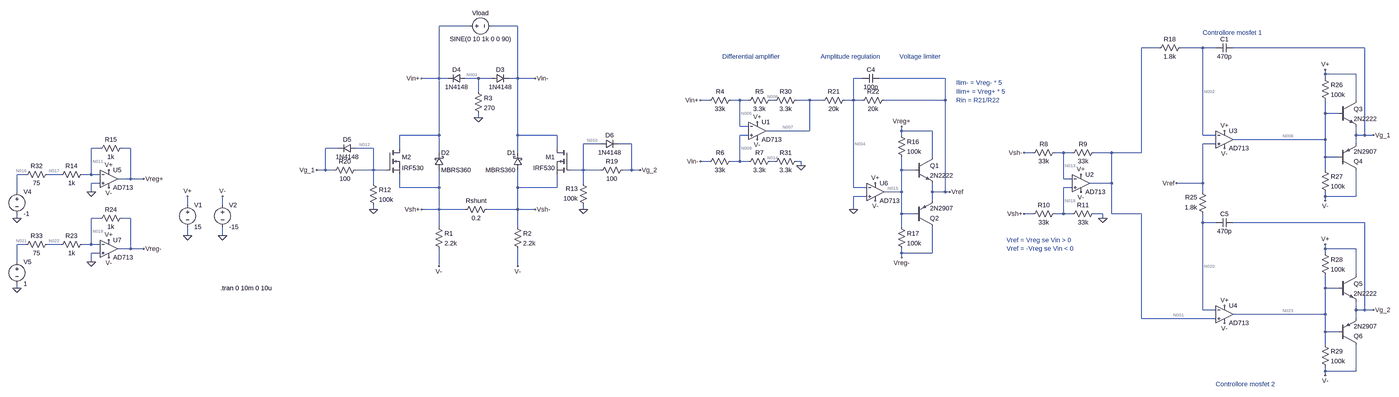
[diagram p0: schematic Electronic load.asc, whole sheet]
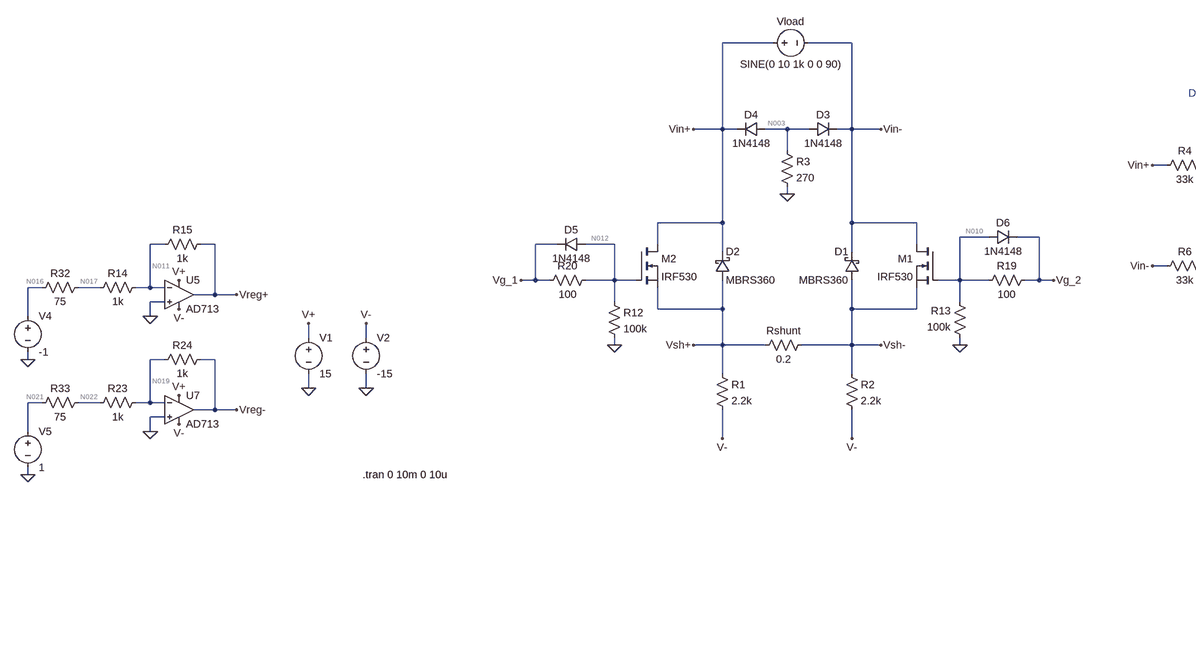
[diagram p1: schematic Electronic load.asc, part, row 1 of 1, column 1 of 2]
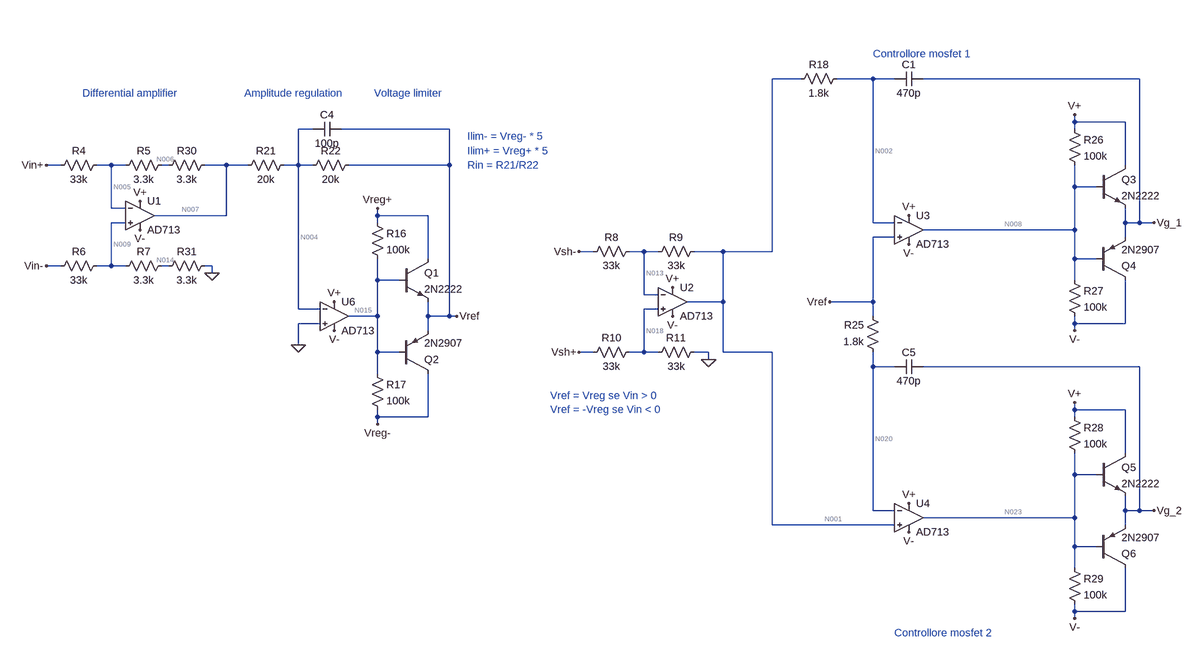
[diagram p2: schematic Electronic load.asc, part, row 1 of 1, column 2 of 2]
Electronic load.asc, the LTspice schematic file:
Version 4
SHEET 1 4616 896
WIRE -144 -496 -256 -496
WIRE 32 -496 -64 -496
WIRE 2464 -416 2400 -416
WIRE 2624 -416 2544 -416
WIRE 2672 -416 2624 -416
WIRE 3280 -416 2736 -416
WIRE 3136 -320 3136 -336
WIRE 3248 -320 3136 -320
WIRE -256 -304 -256 -496
WIRE -256 -304 -320 -304
WIRE -224 -304 -256 -304
WIRE -112 -304 -160 -304
WIRE -64 -304 -112 -304
WIRE 32 -304 32 -496
WIRE 32 -304 0 -304
WIRE 96 -304 32 -304
WIRE 1312 -304 1280 -304
WIRE 1616 -304 1376 -304
WIRE 3136 -304 3136 -320
WIRE -112 -256 -112 -304
WIRE 752 -224 720 -224
WIRE 864 -224 832 -224
WIRE 896 -224 864 -224
WIRE 992 -224 976 -224
WIRE 1120 -224 1072 -224
WIRE 1168 -224 1120 -224
WIRE 1280 -224 1280 -304
WIRE 1280 -224 1248 -224
WIRE 1312 -224 1280 -224
WIRE 1616 -224 1616 -304
WIRE 1616 -224 1392 -224
WIRE 3248 -224 3248 -320
WIRE 3136 -176 3136 -224
WIRE 3184 -176 3136 -176
WIRE -112 -160 -112 -176
WIRE 864 -128 864 -224
WIRE 896 -128 864 -128
WIRE 1120 -112 1120 -224
WIRE 1120 -112 960 -112
WIRE 1456 -112 1456 -128
WIRE 1568 -112 1456 -112
WIRE -256 -96 -256 -304
WIRE -256 -96 -400 -96
WIRE 32 -96 32 -304
WIRE 176 -96 32 -96
WIRE 896 -96 864 -96
WIRE 1456 -96 1456 -112
WIRE 2624 -96 2624 -416
WIRE 2672 -96 2624 -96
WIRE 3248 -96 3248 -128
WIRE 3280 -96 3280 -416
WIRE 3280 -96 3248 -96
WIRE 3312 -96 3280 -96
WIRE 3136 -80 3136 -176
WIRE 3136 -80 2736 -80
WIRE 336 -64 272 -64
WIRE 448 -64 400 -64
WIRE 2672 -64 2624 -64
WIRE 3248 -64 3248 -96
WIRE -1536 -48 -1568 -48
WIRE -1424 -48 -1456 -48
WIRE -624 -48 -672 -48
WIRE -496 -48 -560 -48
WIRE -400 -48 -400 -96
WIRE 176 -48 176 -96
WIRE -256 -32 -256 -96
WIRE 32 -32 32 -96
WIRE 1936 -32 1904 -32
WIRE 2048 -32 2016 -32
WIRE 2080 -32 2048 -32
WIRE 2224 -32 2160 -32
WIRE 2400 -32 2400 -416
WIRE 2400 -32 2224 -32
WIRE 1568 -16 1568 -112
WIRE 3136 -16 3136 -80
WIRE 3184 -16 3136 -16
WIRE 752 0 720 0
WIRE 864 0 864 -96
WIRE 864 0 832 0
WIRE 896 0 864 0
WIRE 992 0 976 0
WIRE 1088 0 1072 0
WIRE 1088 16 1088 0
WIRE -672 32 -672 -48
WIRE -672 32 -704 32
WIRE -640 32 -672 32
WIRE -496 32 -496 -48
WIRE -496 32 -560 32
WIRE -448 32 -496 32
WIRE 272 32 272 -64
WIRE 272 32 224 32
WIRE 336 32 272 32
WIRE 448 32 448 -64
WIRE 448 32 416 32
WIRE 480 32 448 32
WIRE 1456 32 1456 -16
WIRE 1504 32 1456 32
WIRE 3136 32 3136 -16
WIRE -1808 48 -1840 48
WIRE -1680 48 -1728 48
WIRE -1568 48 -1568 -48
WIRE -1568 48 -1600 48
WIRE -1536 48 -1568 48
WIRE -1424 64 -1424 -48
WIRE -1424 64 -1472 64
WIRE -1376 64 -1424 64
WIRE 2048 64 2048 -32
WIRE 2080 64 2048 64
WIRE -1536 80 -1568 80
WIRE -496 80 -496 32
WIRE 272 80 272 32
WIRE 2224 80 2224 -32
WIRE 2224 80 2144 80
WIRE 2624 80 2624 -64
WIRE 2624 80 2528 80
WIRE -400 96 -400 48
WIRE -256 96 -256 32
WIRE -256 96 -400 96
WIRE 32 96 32 32
WIRE 176 96 176 48
WIRE 176 96 32 96
WIRE 1280 96 1280 -224
WIRE 1328 96 1280 96
WIRE 2080 96 2048 96
WIRE -1840 112 -1840 48
WIRE -1568 112 -1568 80
WIRE 1456 112 1456 32
WIRE 1456 112 1392 112
WIRE 1568 112 1568 80
WIRE 1616 112 1616 -224
WIRE 1616 112 1568 112
WIRE 1632 112 1616 112
WIRE 2624 112 2624 80
WIRE 1328 128 1280 128
WIRE 3136 128 3136 112
WIRE 3248 128 3248 32
WIRE 3248 128 3136 128
WIRE 1568 144 1568 112
WIRE 3136 144 3136 128
WIRE -1216 160 -1216 128
WIRE -1088 160 -1088 128
WIRE -496 176 -496 160
WIRE -256 176 -256 96
WIRE -256 176 -320 176
WIRE -160 176 -256 176
WIRE 32 176 32 96
WIRE 32 176 -80 176
WIRE 96 176 32 176
WIRE 272 176 272 160
WIRE 1280 176 1280 128
WIRE 1456 192 1456 112
WIRE 1504 192 1456 192
WIRE 1936 192 1904 192
WIRE 2048 192 2048 96
WIRE 2048 192 2016 192
WIRE 2080 192 2048 192
WIRE 2192 192 2160 192
WIRE 2224 192 2224 80
WIRE 2400 192 2224 192
WIRE -1840 208 -1840 192
WIRE -1536 208 -1568 208
WIRE -1424 208 -1456 208
WIRE 2192 208 2192 192
WIRE 2624 224 2624 192
WIRE 2672 224 2624 224
WIRE 3280 224 2736 224
WIRE -256 240 -256 176
WIRE 32 240 32 176
WIRE 1456 240 1456 192
WIRE -1216 272 -1216 240
WIRE -1088 272 -1088 240
WIRE -1808 304 -1840 304
WIRE -1680 304 -1728 304
WIRE -1568 304 -1568 208
WIRE -1568 304 -1600 304
WIRE -1536 304 -1568 304
WIRE -1424 320 -1424 208
WIRE -1424 320 -1472 320
WIRE -1376 320 -1424 320
WIRE 3136 320 3136 304
WIRE 3248 320 3136 320
WIRE -1536 336 -1568 336
WIRE 1456 336 1456 320
WIRE 1568 336 1568 240
WIRE 1568 336 1456 336
WIRE 3136 336 3136 320
WIRE 1456 352 1456 336
WIRE -1840 368 -1840 304
WIRE -1568 368 -1568 336
WIRE -256 384 -256 320
WIRE 32 384 32 320
WIRE 3248 416 3248 320
WIRE -1840 464 -1840 448
WIRE 3136 464 3136 416
WIRE 3184 464 3136 464
WIRE 2624 544 2624 224
WIRE 2672 544 2624 544
WIRE 3248 544 3248 512
WIRE 3280 544 3280 224
WIRE 3280 544 3248 544
WIRE 3312 544 3280 544
WIRE 3136 560 3136 464
WIRE 3136 560 2736 560
WIRE 2400 576 2400 192
WIRE 2672 576 2400 576
WIRE 3248 576 3248 544
WIRE 3136 624 3136 560
WIRE 3184 624 3136 624
WIRE 3136 672 3136 624
WIRE 3136 768 3136 752
WIRE 3248 768 3248 672
WIRE 3248 768 3136 768
WIRE 3136 784 3136 768
FLAG -1088 272 0
FLAG -1216 272 0
FLAG -1216 128 V+
FLAG -1088 128 V-
FLAG -256 384 V-
FLAG 32 384 V-
FLAG -112 -160 0
FLAG 928 -80 V-
FLAG 928 -144 V+
FLAG 1088 16 0
FLAG 2112 112 V-
FLAG 2112 48 V+
FLAG 2192 208 0
FLAG -320 -304 Vin+
FLAG 96 -304 Vin-
FLAG -320 176 Vsh+
FLAG 96 176 Vsh-
FLAG 720 -224 Vin+
FLAG 720 0 Vin-
FLAG 1904 192 Vsh+
FLAG 1904 -32 Vsh-
FLAG 480 32 Vg_2
FLAG 2704 -48 V-
FLAG 2704 -112 V+
FLAG 3312 -96 Vg_1
FLAG -704 32 Vg_1
FLAG 1456 -128 Vreg+
FLAG 1456 352 Vreg-
FLAG 1360 144 V-
FLAG 1360 80 V+
FLAG 1632 112 Vref
FLAG 2528 80 Vref
FLAG 1280 176 0
FLAG -496 176 0
FLAG 272 176 0
FLAG 3136 -336 V+
FLAG 3136 144 V-
FLAG 2704 592 V-
FLAG 2704 528 V+
FLAG 3136 304 V+
FLAG 3136 784 V-
FLAG 3312 544 Vg_2
FLAG -1504 96 V-
FLAG -1504 32 V+
FLAG -1376 64 Vreg+
FLAG -1840 208 0
FLAG -1568 112 0
FLAG -1504 352 V-
FLAG -1504 288 V+
FLAG -1376 320 Vreg-
FLAG -1568 368 0
FLAG -1840 464 0
SYMBOL voltage -1216 144 R0
SYMATTR InstName V1
SYMATTR Value 15
SYMBOL voltage -1088 144 R0
SYMATTR InstName V2
SYMATTR Value -15
SYMBOL nmos 224 -48 M0
SYMATTR InstName M1
SYMATTR Value IRF530
SYMBOL nmos -448 -48 R0
SYMATTR InstName M2
SYMATTR Value IRF530
SYMBOL schottky -272 32 M180
WINDOW 0 24 64 Left 2
WINDOW 3 24 0 Left 2
SYMATTR InstName D2
SYMATTR Value MBRS360
SYMATTR Description Diode
SYMATTR Type diode
SYMBOL res -176 192 R270
WINDOW 0 32 56 VTop 2
WINDOW 3 0 56 VBottom 2
SYMATTR InstName Rshunt
SYMATTR Value 0.2
SYMBOL res -272 224 R0
SYMATTR InstName R1
SYMATTR Value 2.2k
SYMBOL res 16 224 R0
SYMATTR InstName R2
SYMATTR Value 2.2k
SYMBOL diode -64 -320 M90
WINDOW 0 0 32 VBottom 2
WINDOW 3 32 32 VTop 2
SYMATTR InstName D3
SYMATTR Value 1N4148
SYMBOL diode -160 -288 M270
WINDOW 0 32 32 VTop 2
WINDOW 3 0 32 VBottom 2
SYMATTR InstName D4
SYMATTR Value 1N4148
SYMBOL res -128 -272 R0
SYMATTR InstName R3
SYMATTR Value 270
SYMBOL schottky 48 32 R180
WINDOW 0 24 64 Left 2
WINDOW 3 24 0 Left 2
SYMATTR InstName D1
SYMATTR Value MBRS360
SYMATTR Description Diode
SYMATTR Type diode
SYMBOL OpAmps\\AD713 928 -176 R0
SYMATTR InstName U1
SYMBOL res 848 -240 R90
WINDOW 0 0 56 VBottom 2
WINDOW 3 32 56 VTop 2
SYMATTR InstName R4
SYMATTR Value 33k
SYMBOL res 992 -240 R90
WINDOW 0 0 56 VBottom 2
WINDOW 3 32 56 VTop 2
SYMATTR InstName R5
SYMATTR Value 3.3k
SYMBOL res 848 -16 R90
WINDOW 0 0 56 VBottom 2
WINDOW 3 32 56 VTop 2
SYMATTR InstName R6
SYMATTR Value 33k
SYMBOL res 992 -16 R90
WINDOW 0 0 56 VBottom 2
WINDOW 3 32 56 VTop 2
SYMATTR InstName R7
SYMATTR Value 3.3k
SYMBOL OpAmps\\AD713 2112 16 R0
SYMATTR InstName U2
SYMBOL res 2032 -48 R90
WINDOW 0 0 56 VBottom 2
WINDOW 3 32 56 VTop 2
SYMATTR InstName R8
SYMATTR Value 33k
SYMBOL res 2176 -48 R90
WINDOW 0 0 56 VBottom 2
WINDOW 3 32 56 VTop 2
SYMATTR InstName R9
SYMATTR Value 33k
SYMBOL res 2032 176 R90
WINDOW 0 0 56 VBottom 2
WINDOW 3 32 56 VTop 2
SYMATTR InstName R10
SYMATTR Value 33k
SYMBOL res 2176 176 R90
WINDOW 0 0 56 VBottom 2
WINDOW 3 32 56 VTop 2
SYMATTR InstName R11
SYMATTR Value 33k
SYMBOL voltage -160 -496 M90
WINDOW 0 -32 56 VBottom 2
WINDOW 3 32 56 VTop 2
WINDOW 123 0 0 Left 0
WINDOW 39 0 0 Left 0
SYMATTR InstName Vload
SYMATTR Value SINE(0 10 1k 0 0 90)
SYMBOL OpAmps\\AD713 2704 -144 R0
SYMATTR InstName U3
SYMBOL res 432 16 R90
WINDOW 0 0 56 VBottom 2
WINDOW 3 32 56 VTop 2
SYMATTR InstName R19
SYMATTR Value 100
SYMBOL res -656 48 R270
WINDOW 0 32 56 VTop 2
WINDOW 3 0 56 VBottom 2
SYMATTR InstName R20
SYMATTR Value 100
SYMBOL cap 2736 -432 R90
WINDOW 0 0 32 VBottom 2
WINDOW 3 32 32 VTop 2
SYMATTR InstName C1
SYMATTR Value 470p
SYMBOL res 2560 -432 R90
WINDOW 0 0 56 VBottom 2
WINDOW 3 32 56 VTop 2
SYMATTR InstName R18
SYMATTR Value 1.8k
SYMBOL npn 1504 -16 R0
SYMATTR InstName Q1
SYMATTR Value 2N2222
SYMBOL pnp 1504 240 M180
SYMATTR InstName Q2
SYMATTR Value 2N2907
SYMBOL res 1440 -112 R0
SYMATTR InstName R16
SYMATTR Value 100k
SYMBOL res 1440 224 R0
SYMATTR InstName R17
SYMATTR Value 100k
SYMBOL OpAmps\\AD713 1360 48 R0
SYMATTR InstName U6
SYMBOL res 1264 -240 R90
WINDOW 0 0 56 VBottom 2
WINDOW 3 32 56 VTop 2
SYMATTR InstName R21
SYMATTR Value 20k
SYMBOL res 1408 -240 R90
WINDOW 0 0 56 VBottom 2
WINDOW 3 32 56 VTop 2
SYMATTR InstName R22
SYMATTR Value 20k
SYMBOL cap 1376 -320 R90
WINDOW 0 0 32 VBottom 2
WINDOW 3 32 32 VTop 2
SYMATTR InstName C4
SYMATTR Value 100p
SYMBOL res -512 64 R0
SYMATTR InstName R12
SYMATTR Value 100k
SYMBOL res 288 176 R180
WINDOW 0 36 76 Left 2
WINDOW 3 36 40 Left 2
SYMATTR InstName R13
SYMATTR Value 100k
SYMBOL diode -560 -32 M270
WINDOW 0 32 32 VTop 2
WINDOW 3 0 32 VBottom 2
SYMATTR InstName D5
SYMATTR Value 1N4148
SYMBOL diode 336 -80 M90
WINDOW 0 0 32 VBottom 2
WINDOW 3 32 32 VTop 2
SYMATTR InstName D6
SYMATTR Value 1N4148
SYMBOL npn 3184 -224 R0
SYMATTR InstName Q3
SYMATTR Value 2N2222
SYMBOL pnp 3184 32 M180
SYMATTR InstName Q4
SYMATTR Value 2N2907
SYMBOL res 3120 -320 R0
SYMATTR InstName R26
SYMATTR Value 100k
SYMBOL res 3120 16 R0
SYMATTR InstName R27
SYMATTR Value 100k
SYMBOL OpAmps\\AD713 2704 496 R0
SYMATTR InstName U4
SYMBOL cap 2736 208 R90
WINDOW 0 0 32 VBottom 2
WINDOW 3 32 32 VTop 2
SYMATTR InstName C5
SYMATTR Value 470p
SYMBOL res 2640 208 R180
WINDOW 0 36 76 Left 2
WINDOW 3 36 40 Left 2
SYMATTR InstName R25
SYMATTR Value 1.8k
SYMBOL npn 3184 416 R0
SYMATTR InstName Q5
SYMATTR Value 2N2222
SYMBOL pnp 3184 672 M180
SYMATTR InstName Q6
SYMATTR Value 2N2907
SYMBOL res 3120 320 R0
SYMATTR InstName R28
SYMATTR Value 100k
SYMBOL res 3120 656 R0
SYMATTR InstName R29
SYMATTR Value 100k
SYMBOL res 1088 -240 R90
WINDOW 0 0 56 VBottom 2
WINDOW 3 32 56 VTop 2
SYMATTR InstName R30
SYMATTR Value 3.3k
SYMBOL res 1088 -16 R90
WINDOW 0 0 56 VBottom 2
WINDOW 3 32 56 VTop 2
SYMATTR InstName R31
SYMATTR Value 3.3k
SYMBOL OpAmps\\AD713 -1504 0 R0
SYMATTR InstName U5
SYMBOL res -1584 32 R90
WINDOW 0 0 56 VBottom 2
WINDOW 3 32 56 VTop 2
SYMATTR InstName R14
SYMATTR Value 1k
SYMBOL res -1440 -64 R90
WINDOW 0 0 56 VBottom 2
WINDOW 3 32 56 VTop 2
SYMATTR InstName R15
SYMATTR Value 1k
SYMBOL voltage -1840 96 R0
WINDOW 123 0 0 Left 0
WINDOW 39 0 0 Left 0
SYMATTR InstName V4
SYMATTR Value -1
SYMBOL OpAmps\\AD713 -1504 256 R0
SYMATTR InstName U7
SYMBOL res -1584 288 R90
WINDOW 0 0 56 VBottom 2
WINDOW 3 32 56 VTop 2
SYMATTR InstName R23
SYMATTR Value 1k
SYMBOL res -1440 192 R90
WINDOW 0 0 56 VBottom 2
WINDOW 3 32 56 VTop 2
SYMATTR InstName R24
SYMATTR Value 1k
SYMBOL res -1712 32 R90
WINDOW 0 0 56 VBottom 2
WINDOW 3 32 56 VTop 2
SYMATTR InstName R32
SYMATTR Value 75
SYMBOL voltage -1840 352 R0
WINDOW 123 0 0 Left 0
WINDOW 39 0 0 Left 0
SYMATTR InstName V5
SYMATTR Value 1
SYMBOL res -1712 288 R90
WINDOW 0 0 56 VBottom 2
WINDOW 3 32 56 VTop 2
SYMATTR InstName R33
SYMATTR Value 75
TEXT -1096 464 Left 2 !.tran 0 10m 0 10u
TEXT 1840 288 Left 2 ;Vref = Vreg se Vin > 0\nVref = -Vreg se Vin < 0
TEXT 1448 -384 Left 2 ;Voltage limiter
TEXT 1160 -384 Left 2 ;Amplitude regulation
TEXT 800 -384 Left 2 ;Differential amplifier
TEXT 2624 -472 Left 2 ;Controllore mosfet 1
TEXT 2672 816 Left 2 ;Controllore mosfet 2
TEXT 1656 -224 Left 2 ;Rin = R21/R22
TEXT 1656 -256 Left 2 ;Ilim+ = Vreg+ * 5
TEXT 1656 -288 Left 2 ;Ilim- = Vreg- * 5

The netlist it stands for:
* Electronic load.asc
V1 V+ 0 15
V2 V- 0 -15
M1 Vin- N010 Vsh- Vsh- IRF530
M2 Vin+ N012 Vsh+ Vsh+ IRF530
D2 Vsh+ Vin+ MBRS360
Rshunt Vsh+ Vsh- 0.2
R1 Vsh+ V- 2.2k
R2 Vsh- V- 2.2k
D3 N003 Vin- 1N4148
D4 N003 Vin+ 1N4148
R3 N003 0 270
D1 Vsh- Vin- MBRS360
XU1 N009 N005 V+ V- N007 AD712  ; AD713, pins In+ In- V+ V- OUT
R4 N005 Vin+ 33k
R5 N006 N005 3.3k
R6 N009 Vin- 33k
R7 N014 N009 3.3k
XU2 N018 N013 V+ V- N001 AD712  ; AD713, pins In+ In- V+ V- OUT
R8 N013 Vsh- 33k
R9 N001 N013 33k
R10 N018 Vsh+ 33k
R11 0 N018 33k
Vload Vin+ Vin- SINE(0 10 1k 0 0 90)
XU3 Vref N002 V+ V- N008 AD712  ; AD713, pins In+ In- V+ V- OUT
R19 Vg_2 N010 100
R20 Vg_1 N012 100
C1 Vg_1 N002 470p
R18 N002 N001 1.8k
Q1 Vreg+ N015 Vref 0 2N2222
Q2 Vreg- N015 Vref 0 2N2907
R16 Vreg+ N015 100k
R17 N015 Vreg- 100k
XU6 0 N004 V+ V- N015 AD712  ; AD713, pins In+ In- V+ V- OUT
R21 N004 N007 20k
R22 Vref N004 20k
C4 Vref N004 100p
R12 N012 0 100k
R13 0 N010 100k
D5 N012 Vg_1 1N4148
D6 N010 Vg_2 1N4148
Q3 V+ N008 Vg_1 0 2N2222
Q4 V- N008 Vg_1 0 2N2907
R26 V+ N008 100k
R27 N008 V- 100k
XU4 N001 N020 V+ V- N023 AD712  ; AD713, pins In+ In- V+ V- OUT
C5 Vg_2 N020 470p
R25 N020 Vref 1.8k
Q5 V+ N023 Vg_2 0 2N2222
Q6 V- N023 Vg_2 0 2N2907
R28 V+ N023 100k
R29 N023 V- 100k
R30 N007 N006 3.3k
R31 0 N014 3.3k
XU5 0 N011 V+ V- Vreg+ AD712  ; AD713, pins In+ In- V+ V- OUT
R14 N011 N017 1k
R15 Vreg+ N011 1k
V4 N016 0 -1
XU7 0 N019 V+ V- Vreg- AD712  ; AD713, pins In+ In- V+ V- OUT
R23 N019 N022 1k
R24 Vreg- N019 1k
R32 N017 N016 75
V5 N021 0 1
R33 N022 N021 75
.model D D
.lib standard.dio
.model NPN NPN
.model PNP PNP
.lib standard.bjt
.model NMOS NMOS
.model PMOS PMOS
.lib standard.mos
.tran 0 10m 0 10u
* Vref = Vreg se Vin > 0
* Vref = -Vreg se Vin < 0
* Voltage limiter
* Amplitude regulation
* Differential amplifier
* Controllore mosfet 1
* Controllore mosfet 2
* Rin = R21/R22
* Ilim+ = Vreg+ * 5
* Ilim- = Vreg- * 5
.lib ADI1.lib
.backanno
.end

* Results of the author's LTspice run, read from the files saved beside the schematic
* Operating Point, zero values left out:
*   V(v+) = 15 V
*   V(v-) = -15 V
*   V(vin-) = -3.725 V
*   V(n010) = -3.118 V
*   V(vsh-) = -3.179 V
*   V(vin+) = 6.275 V
*   V(n012) = 3.176 V
*   V(vsh+) = -2.216 V
*   V(n003) = -3.025 V
*   V(n005) = -620.8 mV
*   V(n009) = -620.8 mV
*   V(n007) = -2 V
*   V(n006) = -1.31 V
*   V(n014) = -310.4 mV
*   V(n013) = -1.108 V
*   V(n018) = -1.108 V
*   V(n001) = 962.4 mV
*   V(n002) = 962.4 mV
*   V(vref) = 962.4 mV
*   V(n008) = 3.742 V
*   V(vg_2) = -3.122 V
*   V(vg_1) = 3.179 V
*   V(vreg+) = 954.7 mV
*   V(n015) = 1.983 V
*   V(vreg-) = -930.2 mV
*   V(n004) = -518.8 mV
*   V(n020) = 962.4 mV
*   V(n023) = -3.685 V
*   V(n011) = 12.67 mV
*   V(n017) = -929.3 mV
*   V(n016) = -1 V
*   V(n019) = 2.22 µV
*   V(n022) = 930.2 mV
*   V(n021) = 1 V
*   Ic(Q1) = -25.31 mA
*   Ib(Q1) = 25.39 mA
*   Ie(Q1) = -74.06 µA
*   Ic(Q3) = 31.62 µA
*   Ib(Q3) = 142.1 nA
*   Ie(Q3) = -31.76 µA
*   Ic(Q5) = 18.69 pA
*   Ib(Q5) = -19.25 pA
*   Ic(Q2) = -2.917 pA
*   Ib(Q2) = 3.937 pA
*   Ie(Q2) = -1.02 pA
*   Ic(Q4) = -18.75 pA
*   Ib(Q4) = 19.31 pA
*   Ic(Q6) = -31.07 µA
*   Ib(Q6) = -113.6 nA
*   Ie(Q6) = 31.18 µA
*   Id(M1) = -65.42 mA
*   Is(M1) = 65.42 mA
*   Id(M2) = 4.818 A
*   Is(M2) = -4.818 A
*   I(D2) = -22.6 µA
*   I(D1) = 4.741 A
*   I(D3) = 11.2 mA
*   I(D4) = -2.529 nA
*   I(D5) = -170.6 pA
*   I(D6) = 179.5 pA
*   I(Rshunt) = 4.812 A
*   I(R1) = 5.811 mA
*   I(R2) = 5.373 mA
*   I(R3) = -11.2 mA
*   I(R4) = -209 µA
*   I(R5) = -209 µA
*   I(R6) = 94.06 µA
*   I(R7) = 94.06 µA
*   I(R8) = 62.75 µA
*   I(R9) = 62.75 µA
*   I(R10) = 33.58 µA
*   I(R11) = 33.58 µA
*   I(R19) = -31.18 µA
*   I(R20) = 31.76 µA
*   I(R18) = -27.57 pA
*   I(R16) = -10.28 µA
*   I(R17) = 29.13 µA
*   I(R21) = 74.06 µA
*   I(R22) = 74.06 µA
*   I(R12) = 31.76 µA
*   I(R13) = 31.18 µA
*   I(R26) = 112.6 µA
*   I(R27) = 187.4 µA
*   I(R25) = -27.57 pA
*   I(R28) = 186.8 µA
*   I(R29) = 113.2 µA
*   I(R30) = -209 µA
*   I(R31) = 94.06 µA
*   I(R14) = 942 µA
*   I(R15) = 942 µA
*   I(R23) = -930.2 µA
*   I(R24) = -930.2 µA
*   I(R32) = 942 µA
*   I(R33) = -930.2 µA
*   I(V1) = -59.26 mA
*   I(V2) = 70.63 mA
*   I(Vload) = -4.818 A
*   I(V4) = 942 µA
*   I(V5) = -930.2 µA
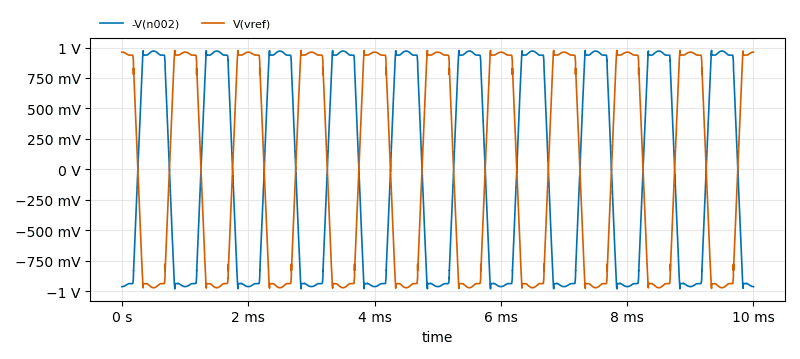
[diagram p3: Transient Analysis of Electronic load.asc, plotted from the saved traces]
* Transient Analysis, 1 run:
*   -V(n002): min -980 mV, max 976.1 mV, average 1.206 mV, rms 845.5 mV, last -962.4 mV
*   V(vref): min -976.7 mV, max 976.8 mV, average -1.208 mV, rms 845.6 mV, last 962.4 mV